# Altium schematic sheet 633nm-LED-Sheet.SchDoc
size 420 x 297 mm; SheetNumber: 2; SheetTotal: 6
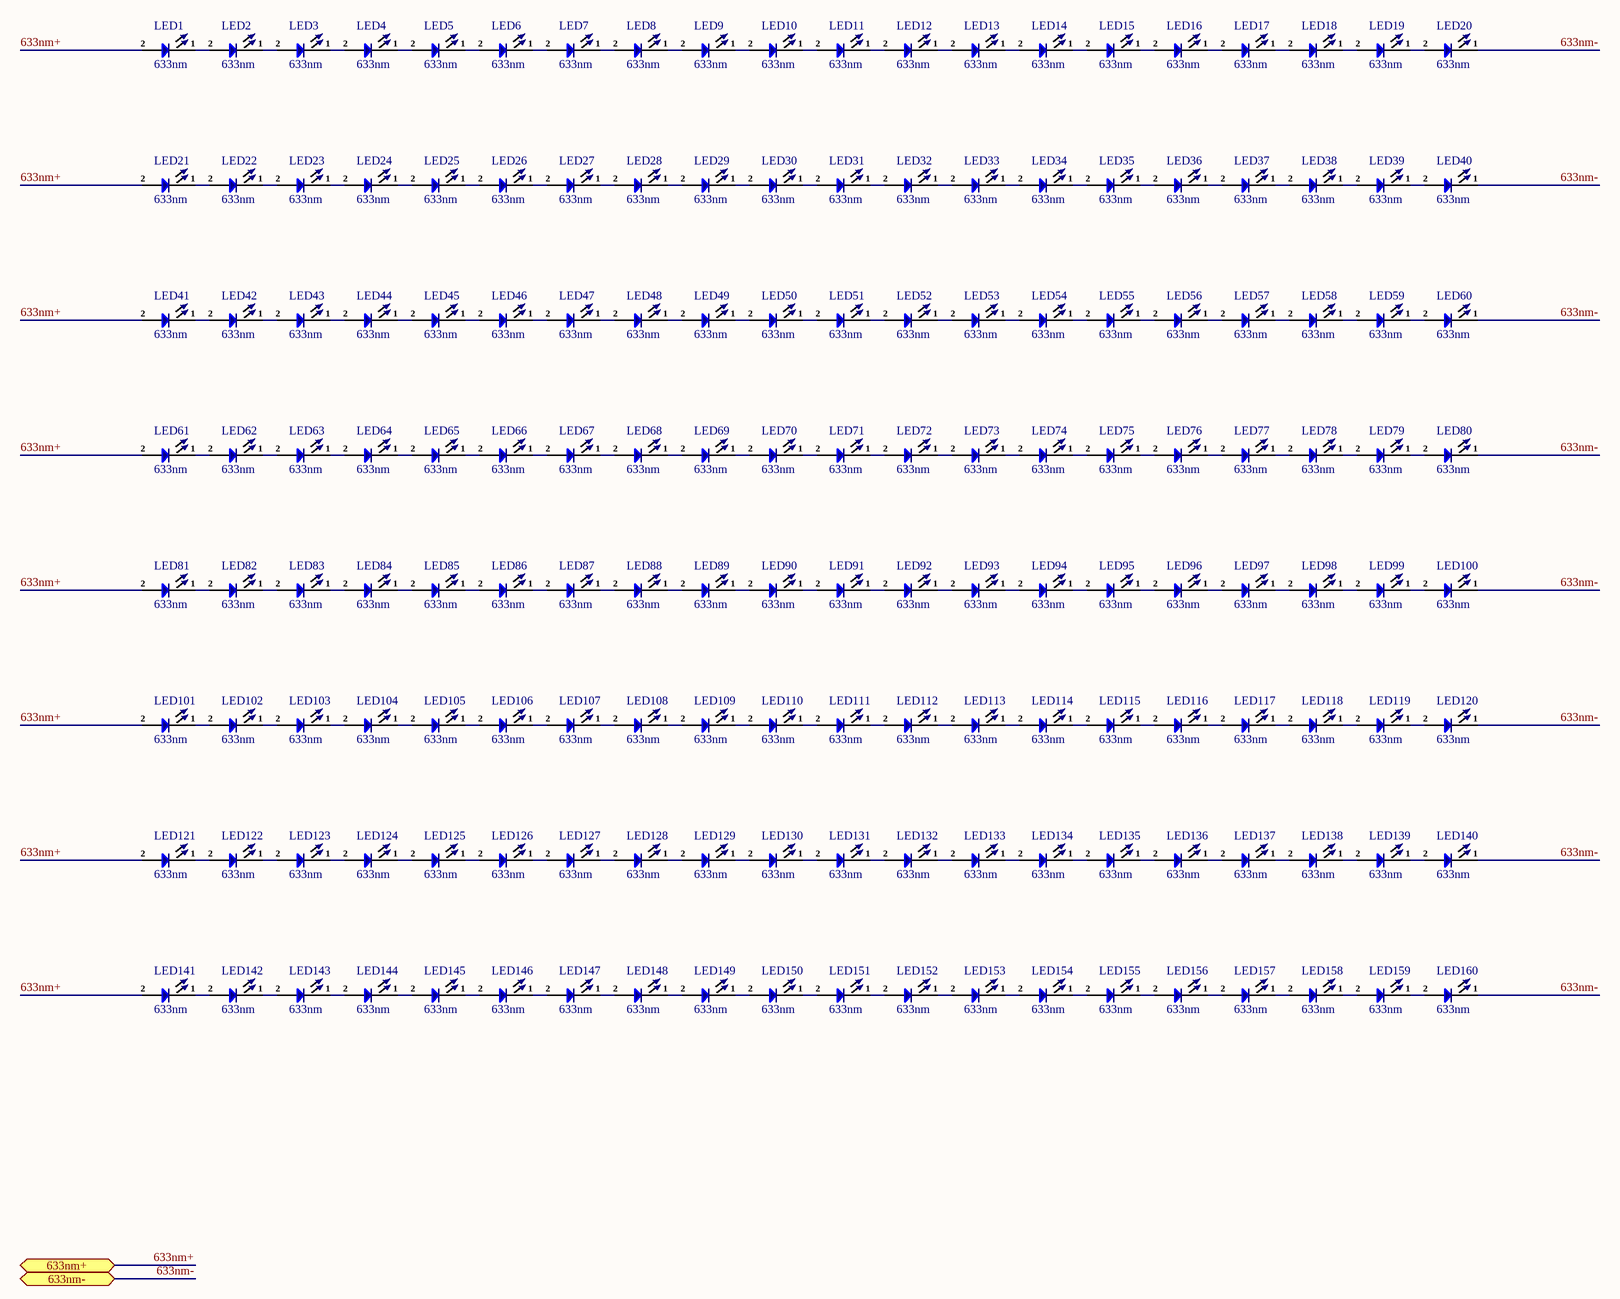
[diagram p0: 633nm-LED-Sheet.SchDoc]

## Parts
LED1  633nm  [TH LED 3mm_]
LED2  633nm  [TH LED 3mm_]
LED3  633nm  [TH LED 3mm_]
LED4  633nm  [TH LED 3mm_]
LED5  633nm  [TH LED 3mm_]
LED6  633nm  [TH LED 3mm_]
LED7  633nm  [TH LED 3mm_]
LED8  633nm  [TH LED 3mm_]
LED9  633nm  [TH LED 3mm_]
LED10  633nm  [TH LED 3mm_]
LED11  633nm  [TH LED 3mm_]
LED12  633nm  [TH LED 3mm_]
LED13  633nm  [TH LED 3mm_]
LED14  633nm  [TH LED 3mm_]
LED15  633nm  [TH LED 3mm_]
LED16  633nm  [TH LED 3mm_]
LED17  633nm  [TH LED 3mm_]
LED18  633nm  [TH LED 3mm_]
LED19  633nm  [TH LED 3mm_]
LED20  633nm  [TH LED 3mm_]
LED21  633nm  [TH LED 3mm_]
LED22  633nm  [TH LED 3mm_]
LED23  633nm  [TH LED 3mm_]
LED24  633nm  [TH LED 3mm_]
LED25  633nm  [TH LED 3mm_]
LED26  633nm  [TH LED 3mm_]
LED27  633nm  [TH LED 3mm_]
LED28  633nm  [TH LED 3mm_]
LED29  633nm  [TH LED 3mm_]
LED30  633nm  [TH LED 3mm_]
LED31  633nm  [TH LED 3mm_]
LED32  633nm  [TH LED 3mm_]
LED33  633nm  [TH LED 3mm_]
LED34  633nm  [TH LED 3mm_]
LED35  633nm  [TH LED 3mm_]
LED36  633nm  [TH LED 3mm_]
LED37  633nm  [TH LED 3mm_]
LED38  633nm  [TH LED 3mm_]
LED39  633nm  [TH LED 3mm_]
LED40  633nm  [TH LED 3mm_]
LED41  633nm  [TH LED 3mm_]
LED42  633nm  [TH LED 3mm_]
LED43  633nm  [TH LED 3mm_]
LED44  633nm  [TH LED 3mm_]
LED45  633nm  [TH LED 3mm_]
LED46  633nm  [TH LED 3mm_]
LED47  633nm  [TH LED 3mm_]
LED48  633nm  [TH LED 3mm_]
LED49  633nm  [TH LED 3mm_]
LED50  633nm  [TH LED 3mm_]
LED51  633nm  [TH LED 3mm_]
LED52  633nm  [TH LED 3mm_]
LED53  633nm  [TH LED 3mm_]
LED54  633nm  [TH LED 3mm_]
LED55  633nm  [TH LED 3mm_]
LED56  633nm  [TH LED 3mm_]
LED57  633nm  [TH LED 3mm_]
LED58  633nm  [TH LED 3mm_]
LED59  633nm  [TH LED 3mm_]
LED60  633nm  [TH LED 3mm_]
LED61  633nm  [TH LED 3mm_]
LED62  633nm  [TH LED 3mm_]
LED63  633nm  [TH LED 3mm_]
LED64  633nm  [TH LED 3mm_]
LED65  633nm  [TH LED 3mm_]
LED66  633nm  [TH LED 3mm_]
LED67  633nm  [TH LED 3mm_]
LED68  633nm  [TH LED 3mm_]
LED69  633nm  [TH LED 3mm_]
LED70  633nm  [TH LED 3mm_]
LED71  633nm  [TH LED 3mm_]
LED72  633nm  [TH LED 3mm_]
LED73  633nm  [TH LED 3mm_]
LED74  633nm  [TH LED 3mm_]
LED75  633nm  [TH LED 3mm_]
LED76  633nm  [TH LED 3mm_]
LED77  633nm  [TH LED 3mm_]
LED78  633nm  [TH LED 3mm_]
LED79  633nm  [TH LED 3mm_]
LED80  633nm  [TH LED 3mm_]
LED81  633nm  [TH LED 3mm_]
LED82  633nm  [TH LED 3mm_]
LED83  633nm  [TH LED 3mm_]
LED84  633nm  [TH LED 3mm_]
LED85  633nm  [TH LED 3mm_]
LED86  633nm  [TH LED 3mm_]
LED87  633nm  [TH LED 3mm_]
LED88  633nm  [TH LED 3mm_]
LED89  633nm  [TH LED 3mm_]
LED90  633nm  [TH LED 3mm_]
LED91  633nm  [TH LED 3mm_]
LED92  633nm  [TH LED 3mm_]
LED93  633nm  [TH LED 3mm_]
LED94  633nm  [TH LED 3mm_]
LED95  633nm  [TH LED 3mm_]
LED96  633nm  [TH LED 3mm_]
LED97  633nm  [TH LED 3mm_]
LED98  633nm  [TH LED 3mm_]
LED99  633nm  [TH LED 3mm_]
LED100  633nm  [TH LED 3mm_]
LED101  633nm  [TH LED 3mm_]
LED102  633nm  [TH LED 3mm_]
LED103  633nm  [TH LED 3mm_]
LED104  633nm  [TH LED 3mm_]
LED105  633nm  [TH LED 3mm_]
LED106  633nm  [TH LED 3mm_]
LED107  633nm  [TH LED 3mm_]
LED108  633nm  [TH LED 3mm_]
LED109  633nm  [TH LED 3mm_]
LED110  633nm  [TH LED 3mm_]
LED111  633nm  [TH LED 3mm_]
LED112  633nm  [TH LED 3mm_]
LED113  633nm  [TH LED 3mm_]
LED114  633nm  [TH LED 3mm_]
LED115  633nm  [TH LED 3mm_]
LED116  633nm  [TH LED 3mm_]
LED117  633nm  [TH LED 3mm_]
LED118  633nm  [TH LED 3mm_]
LED119  633nm  [TH LED 3mm_]
LED120  633nm  [TH LED 3mm_]
LED121  633nm  [TH LED 3mm_]
LED122  633nm  [TH LED 3mm_]
LED123  633nm  [TH LED 3mm_]
LED124  633nm  [TH LED 3mm_]
LED125  633nm  [TH LED 3mm_]
LED126  633nm  [TH LED 3mm_]
LED127  633nm  [TH LED 3mm_]
LED128  633nm  [TH LED 3mm_]
LED129  633nm  [TH LED 3mm_]
LED130  633nm  [TH LED 3mm_]
LED131  633nm  [TH LED 3mm_]
LED132  633nm  [TH LED 3mm_]
LED133  633nm  [TH LED 3mm_]
LED134  633nm  [TH LED 3mm_]
LED135  633nm  [TH LED 3mm_]
LED136  633nm  [TH LED 3mm_]
LED137  633nm  [TH LED 3mm_]
LED138  633nm  [TH LED 3mm_]
LED139  633nm  [TH LED 3mm_]
LED140  633nm  [TH LED 3mm_]
LED141  633nm  [TH LED 3mm_]
LED142  633nm  [TH LED 3mm_]
LED143  633nm  [TH LED 3mm_]
LED144  633nm  [TH LED 3mm_]
LED145  633nm  [TH LED 3mm_]
LED146  633nm  [TH LED 3mm_]
LED147  633nm  [TH LED 3mm_]
LED148  633nm  [TH LED 3mm_]
LED149  633nm  [TH LED 3mm_]
LED150  633nm  [TH LED 3mm_]
LED151  633nm  [TH LED 3mm_]
LED152  633nm  [TH LED 3mm_]
LED153  633nm  [TH LED 3mm_]
LED154  633nm  [TH LED 3mm_]
LED155  633nm  [TH LED 3mm_]
LED156  633nm  [TH LED 3mm_]
LED157  633nm  [TH LED 3mm_]
LED158  633nm  [TH LED 3mm_]
LED159  633nm  [TH LED 3mm_]
LED160  633nm  [TH LED 3mm_]

## Ports
633nm+ (bidir, see Main-Sheet[4B]), 633nm- (bidir, see Main-Sheet[4B])

## Nets
633nm+: LED1.2 LED21.2 LED41.2 LED61.2 LED81.2 LED101.2 LED121.2 LED141.2 ; port 633nm+
633nm-: LED20.1 LED40.1 LED60.1 LED80.1 LED100.1 LED120.1 LED140.1 LED160.1 ; port 633nm-
NetLED1_1: LED1.1 LED2.2
NetLED2_1: LED2.1 LED3.2
NetLED3_1: LED3.1 LED4.2
NetLED4_1: LED4.1 LED5.2
NetLED5_1: LED5.1 LED6.2
NetLED6_1: LED6.1 LED7.2
NetLED7_1: LED7.1 LED8.2
NetLED8_1: LED8.1 LED9.2
NetLED9_1: LED9.1 LED10.2
NetLED10_1: LED10.1 LED11.2
NetLED11_1: LED11.1 LED12.2
NetLED12_1: LED12.1 LED13.2
NetLED13_1: LED13.1 LED14.2
NetLED14_1: LED14.1 LED15.2
NetLED15_1: LED15.1 LED16.2
NetLED16_1: LED16.1 LED17.2
NetLED17_1: LED17.1 LED18.2
NetLED18_1: LED18.1 LED19.2
NetLED19_1: LED19.1 LED20.2
NetLED21_1: LED21.1 LED22.2
NetLED22_1: LED22.1 LED23.2
NetLED23_1: LED23.1 LED24.2
NetLED24_1: LED24.1 LED25.2
NetLED25_1: LED25.1 LED26.2
NetLED26_1: LED26.1 LED27.2
NetLED27_1: LED27.1 LED28.2
NetLED28_1: LED28.1 LED29.2
NetLED29_1: LED29.1 LED30.2
NetLED30_1: LED30.1 LED31.2
NetLED31_1: LED31.1 LED32.2
NetLED32_1: LED32.1 LED33.2
NetLED33_1: LED33.1 LED34.2
NetLED34_1: LED34.1 LED35.2
NetLED35_1: LED35.1 LED36.2
NetLED36_1: LED36.1 LED37.2
NetLED37_1: LED37.1 LED38.2
NetLED38_1: LED38.1 LED39.2
NetLED39_1: LED39.1 LED40.2
NetLED41_1: LED41.1 LED42.2
NetLED42_1: LED42.1 LED43.2
NetLED43_1: LED43.1 LED44.2
NetLED44_1: LED44.1 LED45.2
NetLED45_1: LED45.1 LED46.2
NetLED46_1: LED46.1 LED47.2
NetLED47_1: LED47.1 LED48.2
NetLED48_1: LED48.1 LED49.2
NetLED49_1: LED49.1 LED50.2
NetLED50_1: LED50.1 LED51.2
NetLED51_1: LED51.1 LED52.2
NetLED52_1: LED52.1 LED53.2
NetLED53_1: LED53.1 LED54.2
NetLED54_1: LED54.1 LED55.2
NetLED55_1: LED55.1 LED56.2
NetLED56_1: LED56.1 LED57.2
NetLED57_1: LED57.1 LED58.2
NetLED58_1: LED58.1 LED59.2
NetLED59_1: LED59.1 LED60.2
NetLED61_1: LED61.1 LED62.2
NetLED62_1: LED62.1 LED63.2
NetLED63_1: LED63.1 LED64.2
NetLED64_1: LED64.1 LED65.2
NetLED65_1: LED65.1 LED66.2
NetLED66_1: LED66.1 LED67.2
NetLED67_1: LED67.1 LED68.2
NetLED68_1: LED68.1 LED69.2
NetLED69_1: LED69.1 LED70.2
NetLED70_1: LED70.1 LED71.2
NetLED71_1: LED71.1 LED72.2
NetLED72_1: LED72.1 LED73.2
NetLED73_1: LED73.1 LED74.2
NetLED74_1: LED74.1 LED75.2
NetLED75_1: LED75.1 LED76.2
NetLED76_1: LED76.1 LED77.2
NetLED77_1: LED77.1 LED78.2
NetLED78_1: LED78.1 LED79.2
NetLED79_1: LED79.1 LED80.2
NetLED81_1: LED81.1 LED82.2
NetLED82_1: LED82.1 LED83.2
NetLED83_1: LED83.1 LED84.2
NetLED84_1: LED84.1 LED85.2
NetLED85_1: LED85.1 LED86.2
NetLED86_1: LED86.1 LED87.2
NetLED87_1: LED87.1 LED88.2
NetLED88_1: LED88.1 LED89.2
NetLED89_1: LED89.1 LED90.2
NetLED90_1: LED90.1 LED91.2
NetLED91_1: LED91.1 LED92.2
NetLED92_1: LED92.1 LED93.2
NetLED93_1: LED93.1 LED94.2
NetLED94_1: LED94.1 LED95.2
NetLED95_1: LED95.1 LED96.2
NetLED96_1: LED96.1 LED97.2
NetLED97_1: LED97.1 LED98.2
NetLED98_1: LED98.1 LED99.2
NetLED99_1: LED99.1 LED100.2
NetLED101_1: LED101.1 LED102.2
NetLED102_1: LED102.1 LED103.2
NetLED103_1: LED103.1 LED104.2
NetLED104_1: LED104.1 LED105.2
NetLED105_1: LED105.1 LED106.2
NetLED106_1: LED106.1 LED107.2
NetLED107_1: LED107.1 LED108.2
NetLED108_1: LED108.1 LED109.2
NetLED109_1: LED109.1 LED110.2
NetLED110_1: LED110.1 LED111.2
NetLED111_1: LED111.1 LED112.2
NetLED112_1: LED112.1 LED113.2
NetLED113_1: LED113.1 LED114.2
NetLED114_1: LED114.1 LED115.2
NetLED115_1: LED115.1 LED116.2
NetLED116_1: LED116.1 LED117.2
NetLED117_1: LED117.1 LED118.2
NetLED118_1: LED118.1 LED119.2
NetLED119_1: LED119.1 LED120.2
NetLED121_1: LED121.1 LED122.2
NetLED122_1: LED122.1 LED123.2
NetLED123_1: LED123.1 LED124.2
NetLED124_1: LED124.1 LED125.2
NetLED125_1: LED125.1 LED126.2
NetLED126_1: LED126.1 LED127.2
NetLED127_1: LED127.1 LED128.2
NetLED128_1: LED128.1 LED129.2
NetLED129_1: LED129.1 LED130.2
NetLED130_1: LED130.1 LED131.2
NetLED131_1: LED131.1 LED132.2
NetLED132_1: LED132.1 LED133.2
NetLED133_1: LED133.1 LED134.2
NetLED134_1: LED134.1 LED135.2
NetLED135_1: LED135.1 LED136.2
NetLED136_1: LED136.1 LED137.2
NetLED137_1: LED137.1 LED138.2
NetLED138_1: LED138.1 LED139.2
NetLED139_1: LED139.1 LED140.2
NetLED141_1: LED141.1 LED142.2
NetLED142_1: LED142.1 LED143.2
NetLED143_1: LED143.1 LED144.2
NetLED144_1: LED144.1 LED145.2
NetLED145_1: LED145.1 LED146.2
NetLED146_1: LED146.1 LED147.2
NetLED147_1: LED147.1 LED148.2
NetLED148_1: LED148.1 LED149.2
NetLED149_1: LED149.1 LED150.2
NetLED150_1: LED150.1 LED151.2
NetLED151_1: LED151.1 LED152.2
NetLED152_1: LED152.1 LED153.2
NetLED153_1: LED153.1 LED154.2
NetLED154_1: LED154.1 LED155.2
NetLED155_1: LED155.1 LED156.2
NetLED156_1: LED156.1 LED157.2
NetLED157_1: LED157.1 LED158.2
NetLED158_1: LED158.1 LED159.2
NetLED159_1: LED159.1 LED160.2

## Notes on the sheet
- File:
- Title:
- Date:
- Page
- Num:
- Total:
- Drawn By: Huzaifa Ali

## Library data of the parts
LED1-LED160 = IR LED 3mm: IR Led 3mm Through; ComponentLink1Description: Aliexpress; ComponentLink1URL: https://nl.aliexpress.com/item/32950109432.html?spm=a2g0o.productlist.0.0.2d9749ecxdTGvK&algo_pvid=f3c88197-d0dd-4360-badc-ef5a9d1d435b&algo_exp_id=f3c88197-d0dd-4360-badc-ef5a9d1d435b-1&pdp_ext_f=%7B%22sku_id%22%3A%2266309321327%22%7D